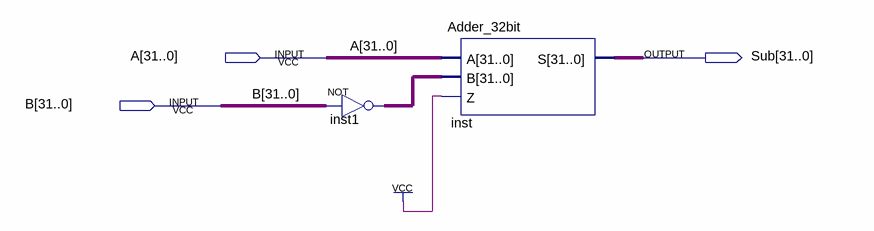
[diagram p0: schematic sheet]
// Quartus schematic Subber_32bit.bdf as structural Verilog: 2 symbols, 3 pins
module Subber_32bit (
  input  [31:0] A,
  input  [31:0] B,
  output [31:0] Sub
);

  wire [31:0] inst1_out;

  assign inst1_out = ~B;  // NOT inst1, 32 bits wide
  Adder_32bit inst (.A(A), .B(inst1_out), .Z(1'b1), .S(Sub));
endmodule
